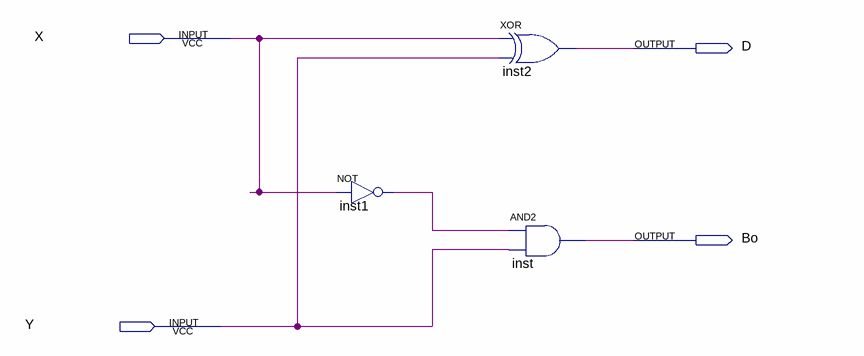
[diagram p0: schematic sheet]
// Quartus schematic Exp04b.bdf as structural Verilog: 3 symbols, 4 pins
module Exp04b (
  input  X,
  input  Y,
  output D,
  output Bo
);

  wire inst1_out;

  not inst1 (inst1_out, X);
  xor inst2 (D, X, Y);
  and inst (Bo, inst1_out, Y);
endmodule
